# Altium project Karta Radiowa.PrjPcb (part 3 of 9)

## Sheet TorGnss.SchDoc
size A3
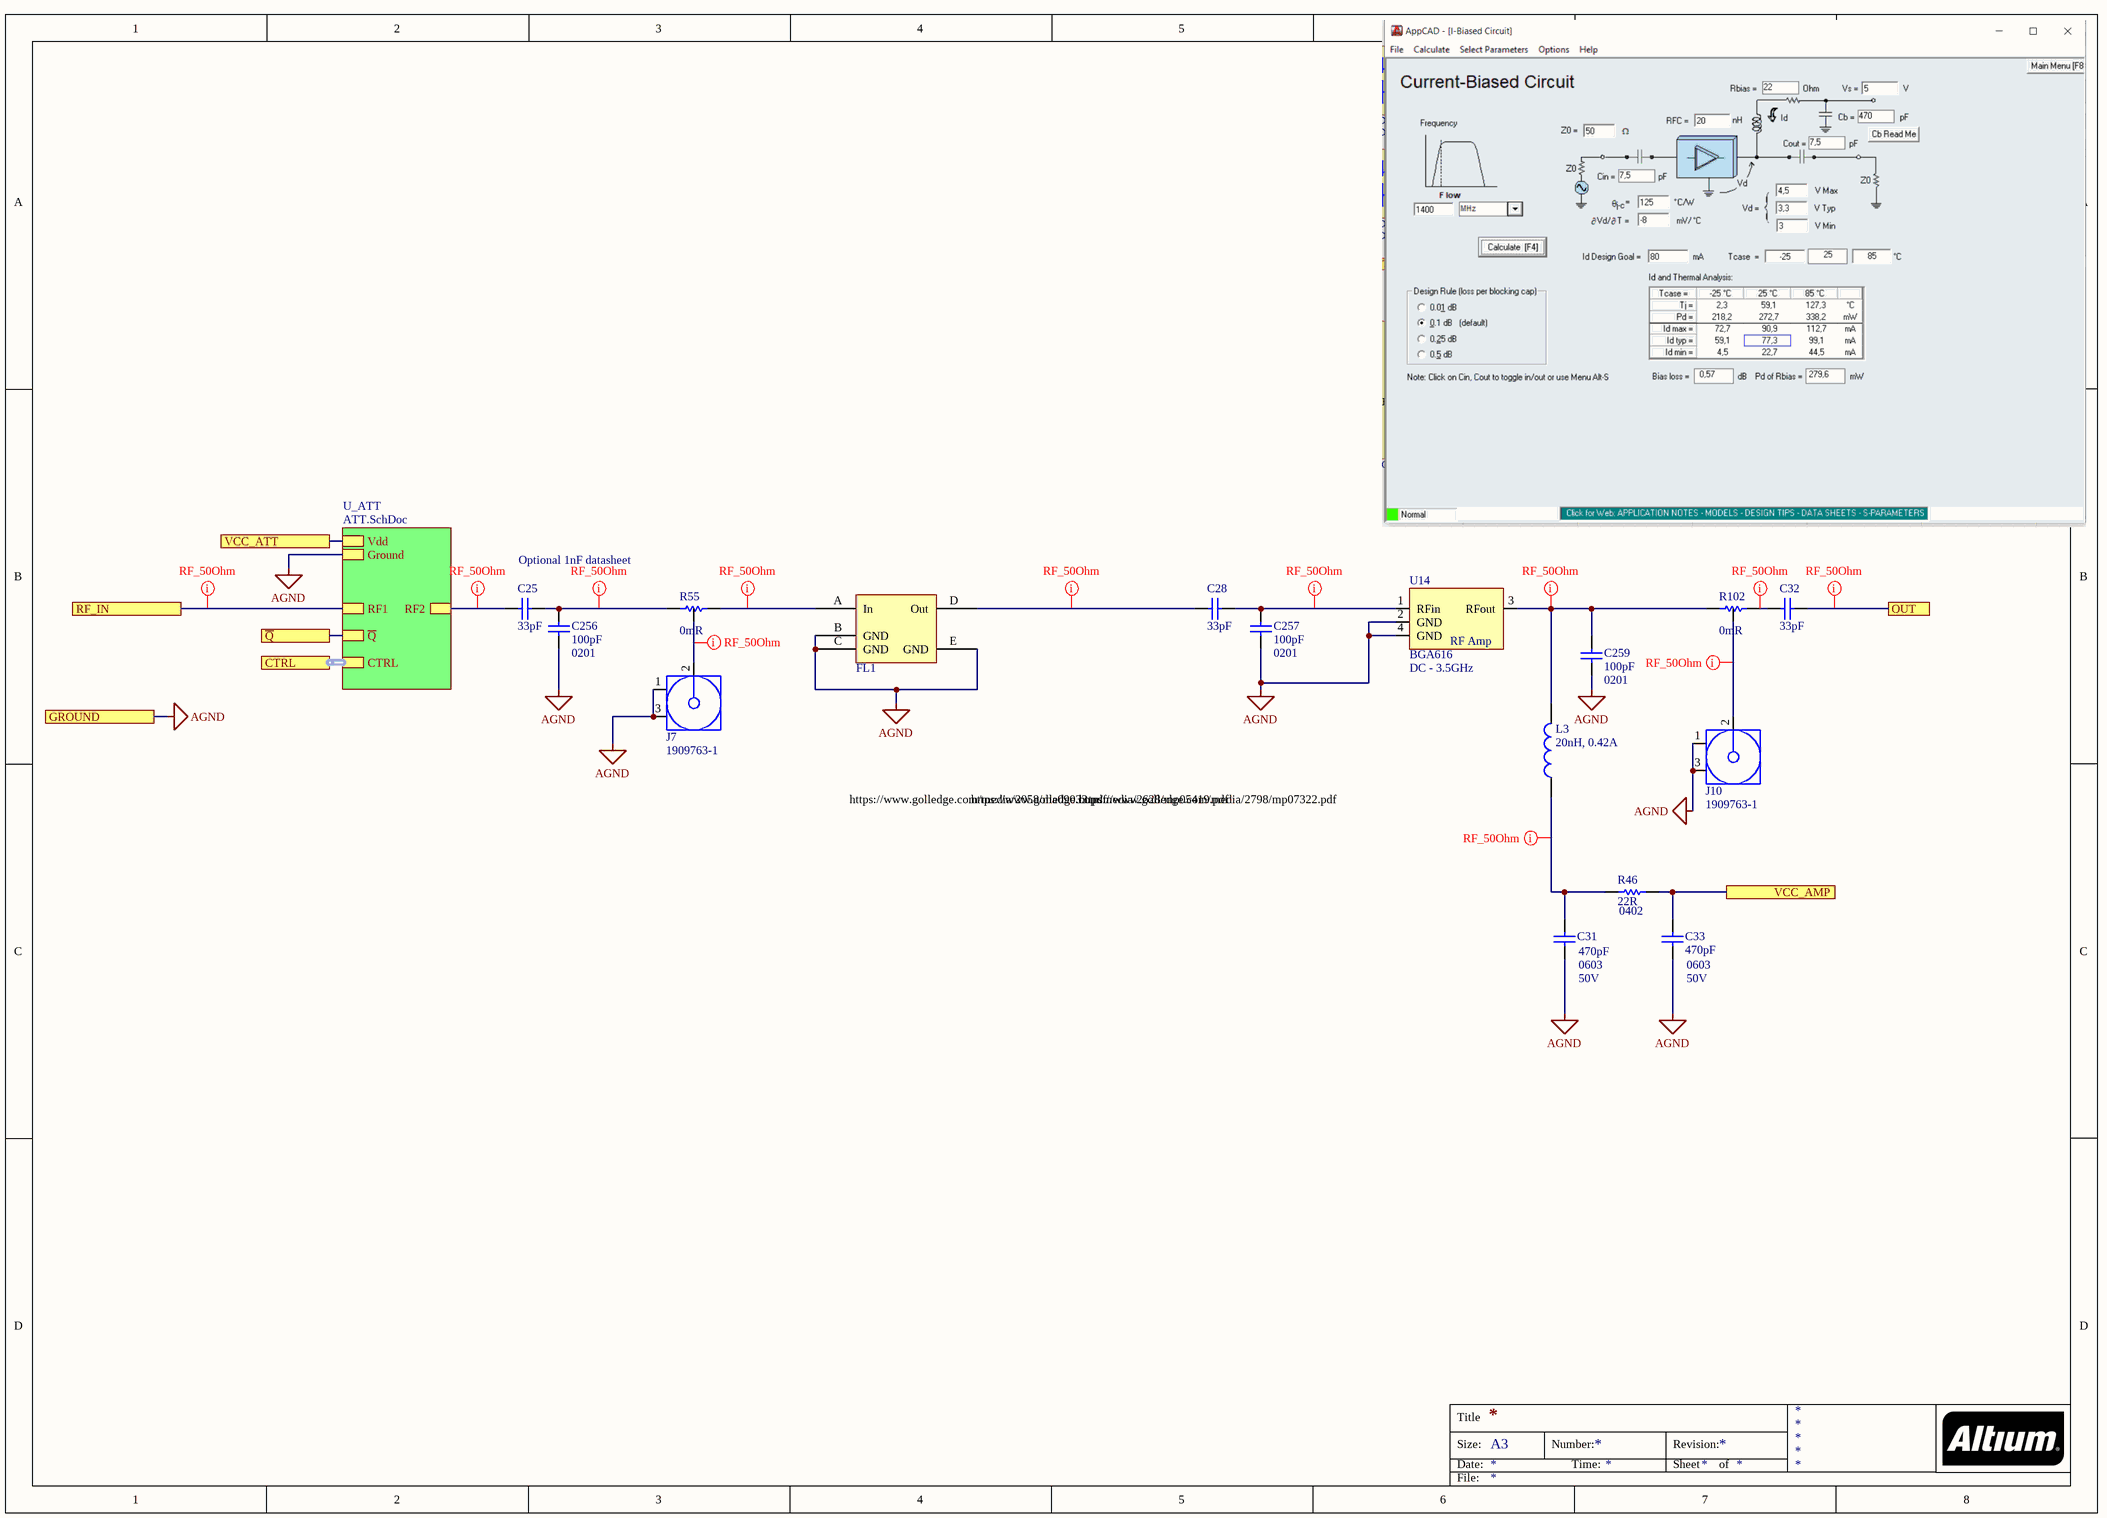
[diagram p4: TorGnss.SchDoc]

### Parts
C25  33pF  [CAP 0402/1005 RF KK]
C28  33pF  [CAP 0402/1005 RF KK]
C31  470pF  Case Code (Imperial): 0603  Voltage Rating: 50V  [CAP 0603/1608 RF]
C32  33pF  [CAP 0402/1005 RF KK]
C33  470pF  Case Code (Imperial): 0603  Voltage Rating: 50V  [CAP 0603/1608 RF]
C256  100pF  Case/Package: 0201  [CAP 0201/0603 KK]
C257  100pF  Case/Package: 0201  [CAP 0201/0603 KK]
C259  100pF  Case/Package: 0201  [CAP 0201/0603 KK]
FL1  TA1954A  [TA1954A]  (value not drawn)
J7  1909763-1  [TECO-1909763-1_V]
J10  1909763-1  [TECO-1909763-1_V]
L3  20nH, 0.42A  [WE-KI_0402]
R46  22R  Case/Package: 0402  [RES 0402/1005 RF KK]
R55  0mR  [RES 0402/1005 RF - 3-PADS]
R102  0mR  [RES 0402/1005 RF - 3-PADS]
U14  BGA616  Frequency: DC - 3.5GHz  [GPS05605]

### Sub-sheets
U_ATT = ATT.SchDoc: Vdd, Ground, RF1, RF2, CTRL (harness ATT_Controle), ~{Q}

### Ports
CTRL, GROUND, OUT, RF_IN, VCC_AMP, VCC_ATT, ~{Q}

### Nets
AGND: C31.1 C33.1 C256.1 C257.1 C259.1 FL1.B(GND) FL1.C(GND) FL1.E(GND) J7.1 J7.3 J10.1 J10.3 U14.2(GND) U14.4(GND) ; port GROUND, sheet U_ATT/Ground  [project net RFGND]
~{Q}: port ~{Q}, sheet U_ATT/~{Q}
Tor_RF_50: C32.2 ; port OUT
VCC_5_ATT: port VCC_ATT, sheet U_ATT/Vdd
VCC_AMP_5: C33.2 R46.2 ; port VCC_AMP
NetC22_2: port RF_IN, sheet U_ATT/RF1
NetC25_1: C25.1 ; sheet U_ATT/RF2
NetC25_2: C25.2 C256.2 R55.2
NetC28_1: C28.1 C257.2 U14.1(RFin)
NetC28_2: C28.2 FL1.D(Out)
NetC31_2: C31.2 L3.1 R46.1
NetC32_1: C32.1 R102.1
NetC259_2: C259.2 L3.2 R102.2 U14.3(RFout)
NetFL1_A: FL1.A(In) R55.1
NetJ7_2: J7.2 R55.3
NetJ10_2: J10.2 R102.3

### Buses and harness runs
harness port CTRL = sheet U_ATT/CTRL

### Layout directives
net class Single50: NetC22_2, NetC25_1, NetC25_2, NetC28_1, NetC28_2, NetC31_2, NetC32_1, NetC259_2, NetFL1_A, NetJ7_2, NetJ10_2, Tor_RF_50

### Notes on the sheet
- Optional 1nF datasheet
- https://www.golledge.com/media/2058/ma09033.pdf
- https://www.golledge.com/media/2628/mp05419.pdf
- https://www.golledge.com/media/2798/mp07322.pdf
- Title
- Size:
- Date:
- A3
- Number:
- Time:
- Revision:
- Sheet
- of
- File:
- (in symbol BGA616) RF Amp

### Library data of the parts
C25 C28 C32 = Capacitor: Manufacturer 1: KEMET; Manufacturer Part Number 1: C0402C330J5GACTU; Dielectric Material: Ceramic; Tolerance: 5%; Dielectric: C0G; Voltage Rating (DC): 50V; Temperature Coefficient: 30ppm/°C; Supplier 1: Digi-Key; Supplier Part Number 1: 399-1017-1-ND; Stock 1: 690392; Pricing 1: 1=0.10000, 10=0.03900, 100=0.01740, 500=0.01240, 1000=0.00974, 2500=0.00886, 5000=0.00815 (USD); RoHS: Yes; Mount: Surface Mount; Case/Package: 0402; Min Operating Temperature: -55°C; Max Operating Temperature: 125°C; Packaging: Tape and Reel; Capacitance: 33pF; Voltage: 50V; Termination: SMD/SMT; Length: 1mm; Height: 0.5mm; Depth: 0.5mm; Radiation Hardening: No; Lead Free: Lead Free; ComponentLink1URL: https://datasheet.ciiva.com/45846/kem-c1003-c0g-smd-45846921.pdf?src-supplier=Onlinecomponents.com; ComponentLink1Description: https://datasheet.ciiva.com/45846/kem-c1003-c0g-smd-45846921.pdf?src-supplier=Onlinecomponents.com
C31 C33 = Capacitor: YAGEO - CC0603KRX7R9BB471 - Multilayer Ceramic Capacitor, CC Series, 470 pF, - 10%, X7R, 50 V, 0603 [1608 Metric] RoHS Compliant: Yes; Insulation Resistance: 10GR; Dissipation Factor: 2.5%; Supplier 1: Digi-Key; Supplier Part Number 1: 311-1078-1-ND; Manufacturer: Yageo; Manufacturer Part Number: CC0603KRX7R9BB471; RoHS: Yes; Category: Ceramic Capacitors; Stock 1: 42824; Pricing 1: 1=0,10000, 10=0,05000, 50=0,02720, 100=0,02230, 500=0,01590, 1000=0,01249 (USD); Mount: Surface Mount; Case/Package: 0603; Number of Pins: 2; Case Code (Metric): 1608; Dielectric Material: Ceramic; Min Operating Temperature: -55°C; Max Operating Temperature: 125°C; Capacitance: 470pF; Tolerance: 10%; Voltage Rating (DC): 50V; Packaging: Tape and Reel; Package Quantity: 1; Dielectric: X7R; Termination: SMD/SMT; Resistor Type: Ceramic; Length: 1.6mm; Height: 0.8mm; Width: 0.8mm; Thickness: 0.035inch; Depth: 0.8mm; Radiation Hardening: No; REACH SVHC: No SVHC; Lead Free: Lead Free; Halogen Free: Halogen Free; ComponentLink1URL: https://datasheet.ciiva.com/5425/upy-gphc-x7r-6-3v-to-50v-8-12304-5425461.pdf?src-supplier=Mouser; ComponentLink1Description: https://datasheet.ciiva.com/5425/upy-gphc-x7r-6-3v-to-50v-8-12304-5425461.pdf?src-supplier=Mouser; ComponentLink2URL: https://datasheet.ciiva.com/144/mlccorderingcode-144439.pdf?src-supplier=Digi-Key; ComponentLink2Description: https://datasheet.ciiva.com/144/mlccorderingcode-144439.pdf?src-supplier=Digi-Key; ComponentLink3URL: https://datasheet.ciiva.com/144/mlccorderingcode-144440.pdf?src-supplier=Digi-Key; ComponentLink3Description: https://datasheet.ciiva.com/144/mlccorderingcode-144440.pdf?src-supplier=Digi-Key; ComponentLink4URL: https://datasheet.ciiva.com/11587/upy-gphc-x7r-6-3v-to-50v-8-11587224.pdf?src-supplier=Avnet; ComponentLink4Description: https://datasheet.ciiva.com/11587/upy-gphc-x7r-6-3v-to-50v-8-11587224.pdf?src-supplier=Avnet; ComponentLink5URL: https://datasheet.ciiva.com/144/mlccorderingcode-144441.pdf?src-supplier=Digi-Key; ComponentLink5Description: https://datasheet.ciiva.com/144/mlccorderingcode-144441.pdf?src-supplier=Digi-Key; ComponentLink6URL: https://datasheet.ciiva.com/16623/upy-gphc-x7r-6-3v-to-50v-8-16623897.pdf?src-supplier=Avnet+Europe; ComponentLink6Description: https://datasheet.ciiva.com/16623/upy-gphc-x7r-6-3v-to-50v-8-16623897.pdf?src-supplier=Avnet+Europe; ComponentLink7URL: https://datasheet.ciiva.com/8033/1489800-8033898.pdf?src-supplier=Element14; ComponentLink7Description: https://datasheet.ciiva.com/8033/1489800-8033898.pdf?src-supplier=Element14; ComponentLink8URL: https://datasheet.ciiva.com/8033/1489800-8033899.pdf?src-supplier=Element14; ComponentLink8Description: https://datasheet.ciiva.com/8033/1489800-8033899.pdf?src-supplier=Element14; ComponentLink9URL: https://datasheet.ciiva.com/26829/getdatasheetpartid-251791-26829452.pdf?src-supplier=Verical; ComponentLink9Description: https://datasheet.ciiva.com/26829/getdatasheetpartid-251791-26829452.pdf?src-supplier=Verical; ComponentLink10URL: https://datasheet.ciiva.com/28450/1489800-28450652.pdf?src-supplier=Element14; ComponentLink10Description: https://datasheet.ciiva.com/28450/1489800-28450652.pdf?src-supplier=Element14; ComponentLink11URL: https://datasheet.ciiva.com/8033/70765-8033902.pdf?src-supplier=Element14; ComponentLink11Description: https://datasheet.ciiva.com/8033/70765-8033902.pdf?src-supplier=Element14
C256 C257 C259 = Capacitor: Multilayer Ceramic Capacitors MLCC - SMD/SMT 0201 100pF 25volts C0G +/-5%; Manufacturer: Murata; Manufacturer Part Number: GRM0335C1E101JA01D; Tolerance: 5%; Voltage: 25V; Supplier 1: Digi-Key; Supplier Part Number 1: 490-3160-1-ND; RoHS: Yes; Category: Ceramic Capacitors; Stock 1: 270262; Pricing 1: 1=0,10000, 10=0,01300, 100=0,00560, 500=0,00400, 1000=0,00315, 2500=0,00286, 5000=0,00263 (USD); Mount: Surface Mount; Case Code (Metric): 0603; Case Code (Imperial): 0201; Min Operating Temperature: -55°C; Max Operating Temperature: 125°C; Dielectric: C0G; Capacitance: 100pF; Termination: SMD/SMT; Package Quantity: 15000; Packaging: Tape and Reel; Voltage Rating: 25V; Voltage Rating (DC): 25V; Length: 0.6mm; Height: 0.3mm; Thickness: 0.013inch; Depth: 0.3mm; Width: 0.012inch; Radiation Hardening: No; REACH SVHC: No SVHC; Lead Free: Lead Free; ComponentLink1URL: https://datasheet.ciiva.com/16497/grm0335c1e101ja01-01-16497112.pdf?src-supplier=Future+Electronics; ComponentLink1Description: https://datasheet.ciiva.com/16497/grm0335c1e101ja01-01-16497112.pdf?src-supplier=Future+Electronics; ComponentLink2URL: https://datasheet.ciiva.com/18697/product-18697797.pdf?src-supplier=Digi-Key; ComponentLink2Description: https://datasheet.ciiva.com/18697/product-18697797.pdf?src-supplier=Digi-Key
FL1 = TA1954A: SAW Filter 1582.470MHz; Center Frequency: 1582.47 MHz; Zs: 50 Ohm; Maximum Input Power: 15 dBm; Zl: 50 Ohm; ComponentLink1Description: Datasheet; ComponentLink1URL: https://www.golledge.com/media/2798/mp07322.pdf
J7 J10 = 1909763-1: Ultra Miniature Coaxial Connector Jack, 60 V, 50 Ohm, -40 to 90 degC, RoHS, Tape and Reel; Brand: TE Connectivity / AMP; Maximum Frequency: 6 GHz; Gender: Jack (Female); Body Material: Liquid Crystal Polymer (LCP); RF Series: UMCC; Impedance: 50 Ohms; DatasheetVersion: Rev. B2; PackageReference: SMD; PackageDescription: 3-Pin Surface Mount Device, Body 2.6 x 2.6 mm; Supplier 1: Newark; Supplier Part Number 1: 62X0488; Supplier 2: Farnell; Supplier Part Number 2: 2781689; Supplier 3: Digi-Key; Supplier Part Number 3: A118077TR-ND; Supplier 4: Digi-Key; Supplier Part Number 4: A118077CT-ND; Supplier 5: Digi-Key; Supplier Part Number 5: A118077DKR-ND; Product Category: RF Connectors / Coaxial Connectors; Packaging: Reel; Product: Connectors; Orientation: Straight; Operating Temperature Range: - 40 C to + 90 C; Factory Pack Quantity: 5000; RoHS: Details; Contact Plating: Gold; Contact Material: Copper Alloy; Mounting Technology: Surface Mount; ComponentLink1Description: Manufacturer URL; ComponentLink1URL: http://www.te.com; ComponentLink2Description: Datasheet; ComponentLink2URL: http://www.te.com/commerce/DocumentDelivery/DDEController?Action=srchrtrv&DocNm=1909763&DocType=Customer+Drawing&DocLang=English
L3 = 744765120A: WE-KI SMT Wire Wound Ceramic Inductor, size 0402, 20nH, 0.42A; Manufacturer: Wurth Elektronik; Q-Factor min.: 25; Inductance Tolerance: +/-5%; DC Resistance max.: 0.25Ohm; Self Resonant Frequency: 3000MHz; ComponentLink1Description: Manufacturer; ComponentLink1URL: http://www.we-online.de; ComponentLink2Description: Datasheet; ComponentLink2URL: https://www.we-online.com/catalog/datasheet/744765120A.pdf; Published Date: April 2020; Rated Current: 0.42A; Packaging: Tape and Reel; Operating Temperature: -40 to +125degC; Manufacturer Part Number: 744765120A; Size: 0402; Inductance: 20nH; Mounting Technology: SMT
R46 = Resistor: YAGEO - RC0402FR-0722RL - SMD ??? ????????, 0402 [1005 ???????????], 22 ??, RC Series, 50 ?, ??????? ??????, 63 ???; Voltage Rating: 50V; Tolerance: 1%; Power Rating: 63mW; Temperature Coefficient: 100ppm/°C; Supplier 1: Digi-Key; Supplier Part Number 1: 311-22.0LRCT-ND; Manufacturer: Yageo; Manufacturer Part Number: RC0402FR-0722RL; RoHS: Yes; Category: Chip SMD Resistors; Stock 1: 8865377; Pricing 1: 1=0,10000, 10=0,01500, 100=0,00620, 1000=0,00278, 2500=0,00242, 5000=0,00200 (USD); Number of Pins: 2; Case Code (Imperial): 0402; Case Code (Metric): 1005; Min Operating Temperature: -55°C; Max Operating Temperature: 155°C; Voltage Rating (DC): 50V; Resistance: 22R; Packaging: Tape and Reel; Termination: SMD/SMT; Resistor Type: Thick Film; Length: 1mm; Height: 0.32mm; Width: 0.5mm; Depth: 0.5mm; REACH SVHC: Unknown; Lead Free: Lead Free; Military Standard: Not; ComponentLink1URL: https://datasheet.ciiva.com/11819/0900766b80c66297-11819462.pdf?src-supplier=RSComponents; ComponentLink1Description: https://datasheet.ciiva.com/11819/0900766b80c66297-11819462.pdf?src-supplier=RSComponents; ComponentLink2URL: https://datasheet.ciiva.com/7849/1018594-7849911.pdf?src-supplier=Element14; ComponentLink2Description: https://datasheet.ciiva.com/7849/1018594-7849911.pdf?src-supplier=Element14; ComponentLink3URL: https://datasheet.ciiva.com/26829/getdatasheetpartid-554995-26829991.pdf?src-supplier=Verical; ComponentLink3Description: https://datasheet.ciiva.com/26829/getdatasheetpartid-554995-26829991.pdf?src-supplier=Verical; ComponentLink4URL: https://datasheet.ciiva.com/7849/1018594-7849912.pdf?src-supplier=Element14; ComponentLink4Description: https://datasheet.ciiva.com/7849/1018594-7849912.pdf?src-supplier=Element14; ComponentLink5URL: https://datasheet.ciiva.com/16930/pyu-rc0402-51-rohs-l-6-r-16930687.pdf?src-supplier=Future+Electronics; ComponentLink5Description: https://datasheet.ciiva.com/16930/pyu-rc0402-51-rohs-l-6-r-16930687.pdf?src-supplier=Future+Electronics
R55 R102 = Resistor: YAGEO - RC0402JR-070RL. - RES, THICK FILM, 0R, 0.0625W, 0402; Power Rating: 62.5mW; Tolerance: 5%; Max Power Dissipation: 63mW; Temperature Coefficient: 200ppm/°C; Voltage Rating: 50V; Supplier 1: Digi-Key; Supplier Part Number 1: 311-0.0JRDKR-ND; Manufacturer: Yageo; Manufacturer Part Number: RC0402JR-070RL; RoHS: Yes; Category: Chip SMD Resistors; Stock 1: 19267045; Pricing 1: 1=0,10000, 10=0,01300, 25=0,00920, 50=0,00720, 100=0,00530, 250=0,00400, 500=0,00320, 1000=0,00236, 5000=0,00169 (USD); Case/Package: 0402; Contact Plating: Tin,Matte; Case Code (Metric): 1005; Case Code (Imperial): 0402; Min Operating Temperature: -55°C; Max Operating Temperature: 155°C; Resistance: 0mR; Packaging: Tape and Reel; Composition: Thick Film; Package Quantity: 1; Number of Terminations: 2; Termination: SMD/SMT; Military Standard: Not; Features: Moisture Resistant; Length: 1mm; Height: 0.016inch; Width: 0.02inch; Depth: 0.5mm; Radiation Hardening: No; Lead Free: Lead Free; REACH SVHC: Unknown; ComponentLink1URL: https://datasheet.ciiva.com/2452/pyu-rc0402-51-rohs-l-6-2452608.pdf?src-supplier=Digi-Key; ComponentLink1Description: https://datasheet.ciiva.com/2452/pyu-rc0402-51-rohs-l-6-2452608.pdf?src-supplier=Digi-Key; ComponentLink2URL: https://datasheet.ciiva.com/11808/0900766b80c66297-11808195.pdf?src-supplier=RSComponents; ComponentLink2Description: https://datasheet.ciiva.com/11808/0900766b80c66297-11808195.pdf?src-supplier=RSComponents; ComponentLink3URL: https://datasheet.ciiva.com/2452/pyu-r-int-thick-7-2452609.pdf?src-supplier=Digi-Key; ComponentLink3Description: https://datasheet.ciiva.com/2452/pyu-r-int-thick-7-2452609.pdf?src-supplier=Digi-Key; ComponentLink4URL: https://datasheet.ciiva.com/2452/pyu-r-int-thick-7-2452610.pdf?src-supplier=Digi-Key; ComponentLink4Description: https://datasheet.ciiva.com/2452/pyu-r-int-thick-7-2452610.pdf?src-supplier=Digi-Key; ComponentLink5URL: https://datasheet.ciiva.com/8896/pyu-rc0402-51-rohs-l-6-8896201.pdf?src-supplier=Avnet; ComponentLink5Description: https://datasheet.ciiva.com/8896/pyu-rc0402-51-rohs-l-6-8896201.pdf?src-supplier=Avnet; ComponentLink6URL: https://datasheet.ciiva.com/28386/pyu-rc0402-51-rohs-l-6-28386633.pdf?src-supplier=Avnet+Europe; ComponentLink6Description: https://datasheet.ciiva.com/28386/pyu-rc0402-51-rohs-l-6-28386633.pdf?src-supplier=Avnet+Europe; ComponentLink7URL: https://datasheet.ciiva.com/22747/1018594-22747515.pdf?src-supplier=Element14; ComponentLink7Description: https://datasheet.ciiva.com/22747/1018594-22747515.pdf?src-supplier=Element14; ComponentLink8URL: https://datasheet.ciiva.com/15189/getdatasheetpartid-326379-15189533.pdf?src-supplier=Verical; ComponentLink8Description: https://datasheet.ciiva.com/15189/getdatasheetpartid-326379-15189533.pdf?src-supplier=Verical; ComponentLink9URL: https://datasheet.ciiva.com/7983/1018594-7983535.pdf?src-supplier=Element14; ComponentLink9Description: https://datasheet.ciiva.com/7983/1018594-7983535.pdf?src-supplier=Element14
U14 = BGA616: Supplier 1: Digi-Key; Supplier Part Number 1: BGA616H6327XTSA1CT-ND

## Sheet ATT.SchDoc
size A3
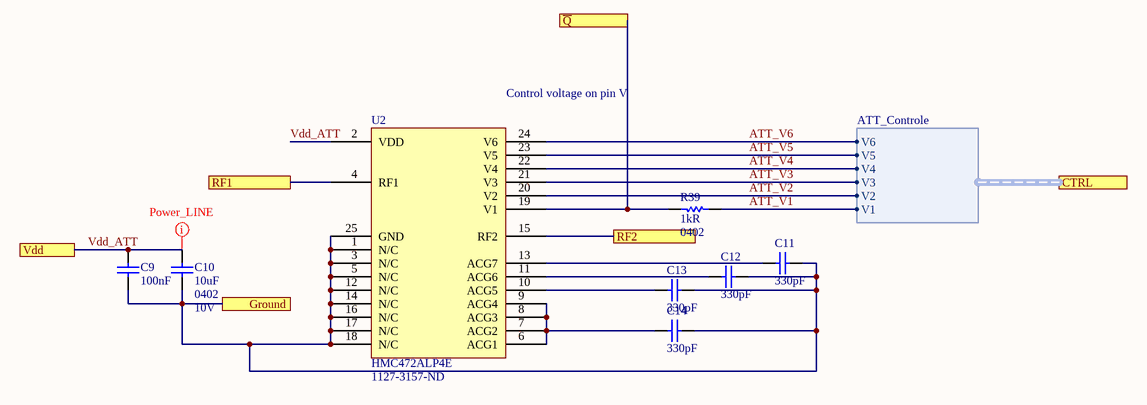
[diagram p5: ATT.SchDoc]

### Parts
C9  100nF  [CAP 0201/0603 KK]
C10  10uF  Case/Package: 0402  Voltage Rating: 10V  [CAP 0402/1005 RF KK]
C11  330pF  [CAP 0402/1005 RF KK]
C12  330pF  [CAP 0402/1005 RF KK]
C13  330pF  [CAP 0402/1005 RF KK]
C14  330pF  [CAP 0402/1005 RF KK]
R39  1kR  Case/Package: 0402  [RES 0402/1005 RF KK]
U2  HMC472ALP4E  Supplier Part Number 1: 1127-3157-ND  [HMC472ALP4E]

### Ports
CTRL (harness ATT_Controle), Ground, RF1, RF2, Vdd, ~{Q}

### Harnesses
ATT_Controle: V1, V2, V3, V4, V5, V6

### Nets
RFGND: C9.1 C10.2 C11.2 C12.2 C13.2 C14.2 U2.1(N/C) U2.3(N/C) U2.5(N/C) U2.12(N/C) U2.14(N/C) U2.16(N/C) U2.17(N/C) U2.18(N/C) U2.25(GND) ; port Ground
ATT_V1: R39.2 ; port CTRL.V1
ATT_V2: U2.20(V2) ; port CTRL.V2
ATT_V3: U2.21(V3) ; port CTRL.V3
ATT_V4: U2.22(V4) ; port CTRL.V4
ATT_V5: U2.23(V5) ; port CTRL.V5
ATT_V6: U2.24(V6) ; port CTRL.V6
~{Q}: R39.1 U2.19(V1) ; port ~{Q}
Vdd_ATT: C9.2 C10.1 U2.2(VDD) ; port Vdd  [project net VCC_5_ATT]
NetC11_1: C11.1 U2.13(ACG7)
NetC12_1: C12.1 U2.11(ACG6)
NetC13_1: C13.1 U2.10(ACG5)
NetC14_1: C14.1 U2.6(ACG1) U2.7(ACG2) U2.8(ACG3) U2.9(ACG4)
NetC22_2: U2.4(RF1) ; port RF1
NetC25_1: U2.15(RF2) ; port RF2

### Layout directives
net class Power_LINE: VCC_5_ATT

### Notes on the sheet
- (near U2) Control voltage on pin V
- Title
- Size:
- Date:
- A3
- Number:
- Time:
- Revision:
- Sheet
- of
- File:

### Library data of the parts
C9 = Capacitor: Manufacturer 1: Murata; Manufacturer Part Number 1: GRM033R61C104ME84D; Voltage Rating: 16V; Tolerance: 20%; Dielectric: X5R; Supplier 1: Digi-Key; Supplier Part Number 1: 490-9986-1-ND; Stock 1: 550070; Pricing 1: 1=0.10000, 10=0.05400, 100=0.02430, 500=0.01732, 1000=0.01361, 2500=0.01238, 5000=0.01139 (USD); RoHS: Yes; Mount: Surface Mount; Case/Package: 0201; Weight: 1.2E-05oz; Case Code (Metric): 0603; Case Code (Imperial): 0201; Min Operating Temperature: -55°C; Max Operating Temperature: 85°C; Capacitance: 100nF; Packaging: Tape and Reel; Termination: SMD/SMT; Voltage Rating (DC): 16V; Package Quantity: 15000; Length: 0.024inch; Height: 0.3mm; Width: 0.3mm; Thickness: 0.013inch; ComponentLink1URL: http://www.mouser.com/ds/2/281/c02e-2905.pdf?src-supplier=Mouser; ComponentLink1Description: http://www.mouser.com/ds/2/281/c02e-2905.pdf?src-supplier=Mouser; ComponentLink2URL: http://search.murata.co.jp/Ceramy/image/img/A01X/G101/ENG/GRM033R61C104ME84-01.pdf?src-supplier=Digi-Key; ComponentLink2Description: http://search.murata.co.jp/Ceramy/image/img/A01X/G101/ENG/GRM033R61C104ME84-01.pdf?src-supplier=Digi-Key
C10 = Capacitor: CAP CER 10UF 10V X5R 0402; Manufacturer: Samsung; Manufacturer Part Number: CL05A106MP8NUB8; Tolerance: 20%; Supplier 1: Digi-Key; Supplier Part Number 1: 1276-6830-1-ND; RoHS: Yes; Category: Ceramic Capacitors; Stock 1: 1457006; Pricing 1: 1=0,40000, 10=0,27900, 50=0,19500, 100=0,16710, 500=0,12534, 1000=0,10584, 2500=0,10027 (USD); Mount: Surface Mount; Case Code (Metric): 1005; Case Code (Imperial): 0402; Min Operating Temperature: -55°C; Max Operating Temperature: 85°C; Packaging: Tape and Reel; Capacitance: 10uF; Length: 0.039inch; Width: 0.02inch; Thickness: 0.035inch; ComponentLink1URL: http://www.samsungsem.com/kr/support/product-search/mlcc/CL05A106MP8NUB8.jsp?src-supplier=Digi-Key; ComponentLink1Description: http://www.samsungsem.com/kr/support/product-search/mlcc/CL05A106MP8NUB8.jsp?src-supplier=Digi-Key
C11-C14 = Capacitor: Manufacturer 1: Walsin Technologies; Manufacturer Part Number 1: 0402N331F500CT; Tolerance: 1%; Dielectric: C0G; Supplier 1: Digi-Key; Supplier Part Number 1: 1292-1307-1-ND; Stock 1: 23341; Pricing 1: 1=0.12000, 10=0.09000, 100=0.04030, 500=0.02876, 1000=0.02260, 2500=0.02054, 5000=0.01890 (USD); RoHS: Yes; Case/Package: 0402; Min Operating Temperature: -55°C; Max Operating Temperature: 125°C; Packaging: Tape and Reel; Capacitance: 330pF; Length: 1mm; Depth: 0.5mm; ComponentLink1URL: http://components.arrow.com/part/dataview/0323_06535843?src-supplier=Arrow+Europe; ComponentLink1Description: http://components.arrow.com/part/dataview/0323_06535843?src-supplier=Arrow+Europe; ComponentLink2URL: http://www.passivecomponent.com/indexsea/0402N331F500CT-IN.pdf?src-supplier=Digi-Key; ComponentLink2Description: http://www.passivecomponent.com/indexsea/0402N331F500CT-IN.pdf?src-supplier=Digi-Key
R39 = Resistor: Manufacturer 1: Yageo; Manufacturer Part Number 1: RC0402FR-071KL; Tolerance: 1%; Temperature Coefficient: 100ppm/°C; Power Rating: 62.5mW; Voltage Rating: 50V; Supplier 1: Digi-Key; Supplier Part Number 1: 311-1.00KLRCT-ND; Stock 1: 57541929; Pricing 1: 1=0,10000, 10=0,01600, 100=0,00640, 1000=0,00289, 2500=0,00251, 5000=0,00207 (USD); RoHS: Yes; Number of Pins: 2; Case Code (Imperial): 0402; Case Code (Metric): 1005; Min Operating Temperature: -55°C; Max Operating Temperature: 155°C; Packaging: Tape and Reel; Resistance: 1kR; Composition: Thick Film; Voltage Rating (DC): 50V; Termination: SMD/SMT; Military Standard: Not; Length: 1mm; Height: 0.32mm; Width: 0.5mm; Depth: 0.5mm; REACH SVHC: Unknown; Lead Free: Lead Free; ComponentLink1URL: https://datasheet.ciiva.com/11819/0900766b80c66297-11819477.pdf?src-supplier=RSComponents; ComponentLink1Description: https://datasheet.ciiva.com/11819/0900766b80c66297-11819477.pdf?src-supplier=RSComponents; ComponentLink2URL: https://datasheet.ciiva.com/12666/pyu-rc0402-51-rohs-l-6-r-12666741.pdf?src-supplier=Mouser; ComponentLink2Description: https://datasheet.ciiva.com/12666/pyu-rc0402-51-rohs-l-6-r-12666741.pdf?src-supplier=Mouser; ComponentLink3URL: https://datasheet.ciiva.com/17063/pyu-rc0402-51-rohs-l-6-r-17063193.pdf?src-supplier=Future+Electronics; ComponentLink3Description: https://datasheet.ciiva.com/17063/pyu-rc0402-51-rohs-l-6-r-17063193.pdf?src-supplier=Future+Electronics; ComponentLink4URL: https://datasheet.ciiva.com/22747/1018594-22747513.pdf?src-supplier=Element14; ComponentLink4Description: https://datasheet.ciiva.com/22747/1018594-22747513.pdf?src-supplier=Element14; ComponentLink5URL: https://datasheet.ciiva.com/7849/1018594-7849869.pdf?src-supplier=Element14; ComponentLink5Description: https://datasheet.ciiva.com/7849/1018594-7849869.pdf?src-supplier=Element14; ComponentLink6URL: https://datasheet.ciiva.com/7983/1018594-7983502.pdf?src-supplier=Element14; ComponentLink6Description: https://datasheet.ciiva.com/7983/1018594-7983502.pdf?src-supplier=Element14; ComponentLink7URL: https://datasheet.ciiva.com/7849/1018594-7849871.pdf?src-supplier=Element14; ComponentLink7Description: https://datasheet.ciiva.com/7849/1018594-7849871.pdf?src-supplier=Element14
U2 = HMC472ALP4E: ANALOG DEVICES   HMC472ALP4E   RF ATTENUATOR, 3.8GHZ, 5.5V, HQFN-24; Min Supply Voltage: 4.5V; Attenuation Value: 31.5dB; Impedance: 50R; Max Power Dissipation: 560mW; Number of Bits: 6; Number of Channels: 1; Insertion Loss: 3dB; Operating Supply Voltage: 5V; Supplier 1: Digi-Key; Manufacturer: Analog Devices; Manufacturer Part Number: HMC472ALP4E; Stock 1: 867; Pricing 1: 1 = 7,47000, 10 = 6,84400, 25 = 6,22160, 100 = 5,59940, 250 = 5,13284, 500 = 4,66620, 1000 = 4,19958 (USD); RoHS: Yes; Mount: Surface Mount; Case/Package: SMD/SMT; Number of Pins: 24; Contact Plating: Tin,Matte; Min Operating Temperature: -40°C; Max Operating Temperature: 85°C; Max Supply Voltage: 5.5V; Packaging: Cut Tape; Max Frequency: 3.8GHz; Package Quantity: 50; Min Input Voltage: 4.5V; Max Input Voltage: 5.5V; REACH SVHC: No SVHC; Lead Free: Contains Lead; ComponentLink1URL: http://www.mouser.com/ds/2/609/hmc472a-879296.pdf?src-supplier=Mouser; ComponentLink1Description: http://www.mouser.com/ds/2/609/hmc472a-879296.pdf?src-supplier=Mouser; ComponentLink2URL: http://www.analog.com/media/en/technical-documentation/data-sheets/hmc472a.pdf?src-supplier=Avnet+Asia; ComponentLink2Description: http://www.analog.com/media/en/technical-documentation/data-sheets/hmc472a.pdf?src-supplier=Avnet+Asia; ComponentLink3URL: http://www.farnell.com/datasheets/1868224.pdf?src-supplier=Element14; ComponentLink3Description: http://www.farnell.com/datasheets/1868224.pdf?src-supplier=Element14; ComponentLink4URL: https://www.hittite.com/content/documents/data_sheet/hmc472alp4.pdf?src-supplier=Avnet; ComponentLink4Description: https://www.hittite.com/content/documents/data_sheet/hmc472alp4.pdf?src-supplier=Avnet; ComponentLink5URL: https://www.analog.com/media/en/technical-documentation/data-sheets/hmc472a.pdf?src-supplier=Digi-Key; ComponentLink5Description: https://www.analog.com/media/en/technical-documentation/data-sheets/hmc472a.pdf?src-supplier=Digi-Key